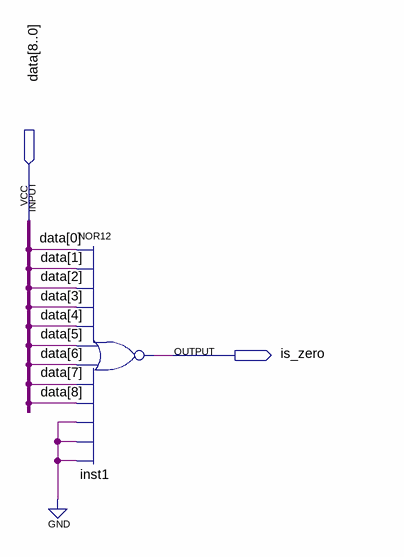
[diagram p0: schematic sheet]
// Quartus schematic zero_detect.bdf as structural Verilog: 1 symbols, 2 pins
module zero_detect (
  input  [8:0] data,
  output is_zero
);

  nor inst1 (is_zero, data[0], data[1], data[2], data[3], data[4], data[5], data[6], data[7], data[8], 1'b0, 1'b0, 1'b0);
endmodule
